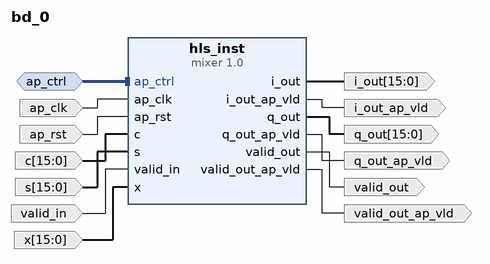
[diagram p0: block diagram of the top level]
# Vivado block design bd_0, xczu5eg-sfvc784-1-e, Vivado 2023.1
create_bd_design bd_0

create_bd_intf_port -mode Slave -vlnv xilinx.com:interface:acc_handshake_rtl:1.0 ap_ctrl
create_bd_port -dir I -type clk ap_clk
set_property -dict {CONFIG.FREQ_HZ 100000000.0} [get_bd_ports ap_clk]
create_bd_port -dir I -type rst ap_rst
set_property -dict {CONFIG.POLARITY ACTIVE_HIGH} [get_bd_ports ap_rst]
create_bd_port -dir I -from 15 -to 0 -type data c
create_bd_port -dir O -from 15 -to 0 -type data i_out
create_bd_port -dir O i_out_ap_vld
create_bd_port -dir O -from 15 -to 0 -type data q_out
create_bd_port -dir O q_out_ap_vld
create_bd_port -dir I -from 15 -to 0 -type data s
create_bd_port -dir I -type data valid_in
create_bd_port -dir O -type data valid_out
create_bd_port -dir O valid_out_ap_vld
create_bd_port -dir I -from 15 -to 0 -type data x

create_bd_cell -type ip -vlnv xilinx.com:hls:mixer:1.0 hls_inst

# ---- connections ----

connect_bd_intf_net -intf_net ap_ctrl_0_1 [get_bd_intf_ports ap_ctrl] [get_bd_intf_pins hls_inst/ap_ctrl]
connect_bd_net -net ap_clk_0_1 [get_bd_ports ap_clk] [get_bd_pins hls_inst/ap_clk]
connect_bd_net -net ap_rst_0_1 [get_bd_ports ap_rst] [get_bd_pins hls_inst/ap_rst]
connect_bd_net -net c_0_1 [get_bd_ports c] [get_bd_pins hls_inst/c]
connect_bd_net [get_bd_pins hls_inst/i_out] [get_bd_ports i_out]
connect_bd_net [get_bd_pins hls_inst/i_out_ap_vld] [get_bd_ports i_out_ap_vld]
connect_bd_net [get_bd_pins hls_inst/q_out] [get_bd_ports q_out]
connect_bd_net [get_bd_pins hls_inst/q_out_ap_vld] [get_bd_ports q_out_ap_vld]
connect_bd_net [get_bd_pins hls_inst/valid_out] [get_bd_ports valid_out]
connect_bd_net [get_bd_pins hls_inst/valid_out_ap_vld] [get_bd_ports valid_out_ap_vld]
connect_bd_net -net s_0_1 [get_bd_ports s] [get_bd_pins hls_inst/s]
connect_bd_net -net valid_in_0_1 [get_bd_ports valid_in] [get_bd_pins hls_inst/valid_in]
connect_bd_net -net x_0_1 [get_bd_ports x] [get_bd_pins hls_inst/x]

validate_bd_design
save_bd_design
